# Altium project ADV212BBCZ-150.PrjPcb (part 2 of 2)

## Sheet PowerSupply.SchDoc
size A4; SheetNumber: 7; SheetTotal: 8
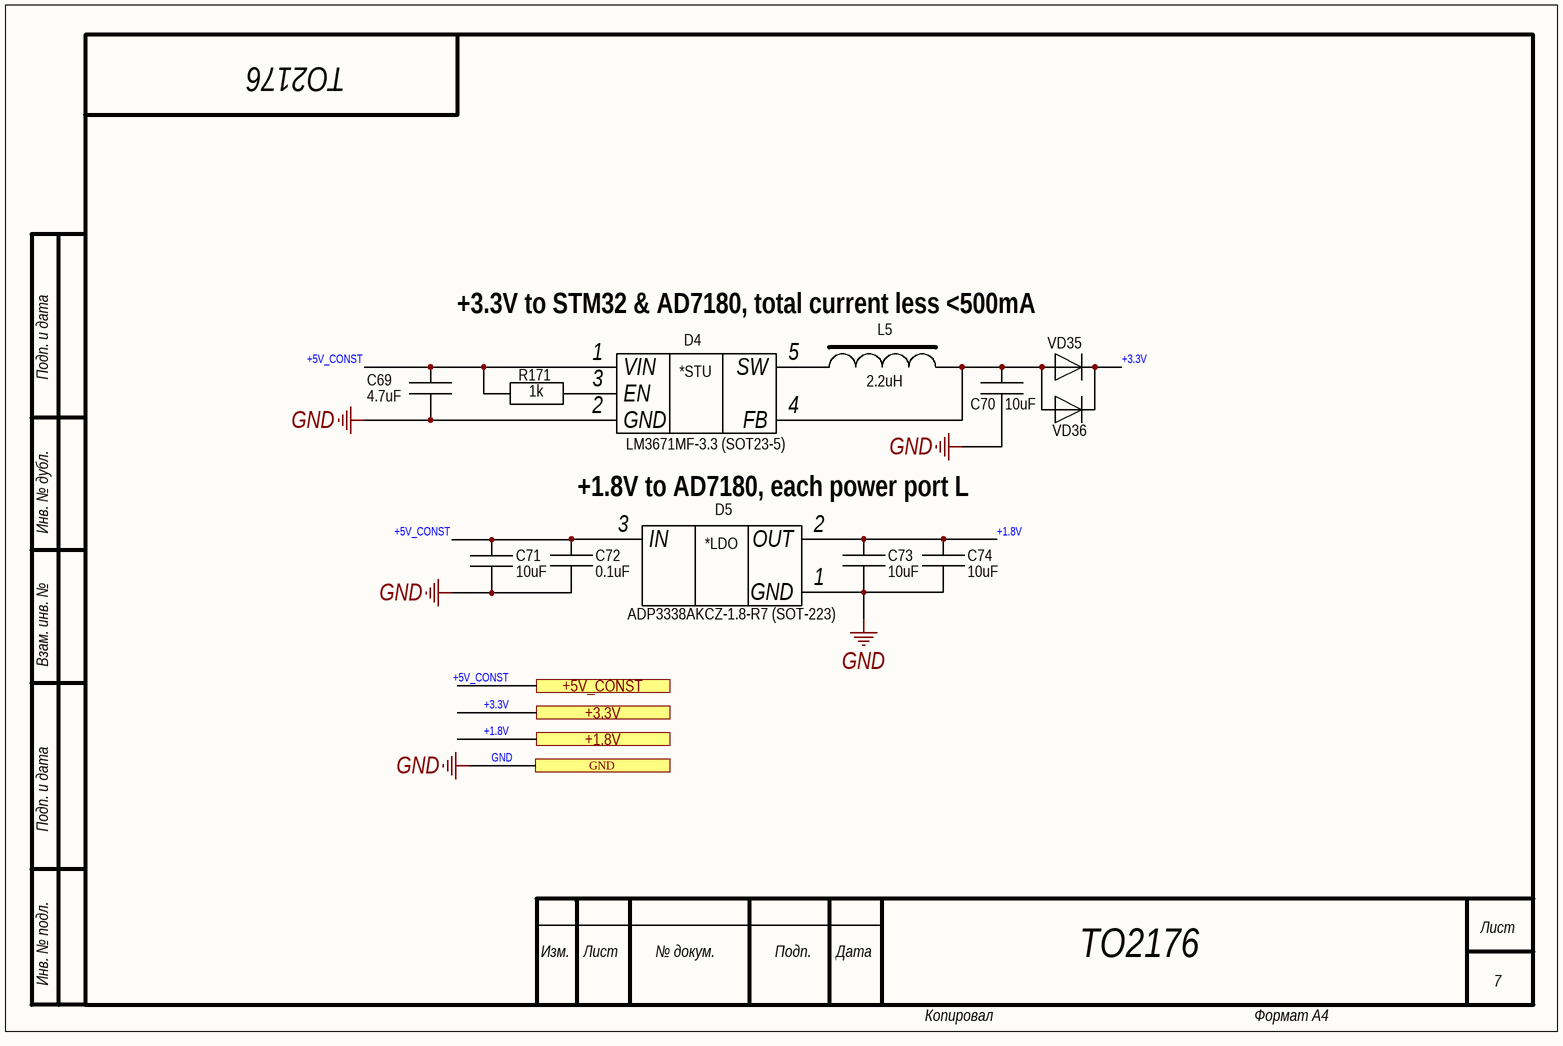
[diagram p7: PowerSupply.SchDoc]

### Parts
C69  4.7uF  [0603]
C70  10uF  [0603]
C71  10uF  [0603]
C72  0.1uF  [0603]
C73  10uF  [0603]
C74  10uF  [0603]
D4  LM3671MF-3.3 (SOT23-5)  [SOT-23-5]
D5  ADP3338AKCZ-1.8-R7 (SOT-223)  [SOT-223]
L5  2.2uH  [SRN3015 (3x3x1.5)]
R171  1k  [0603]
VD35  BAT60JFILM (SOD323)  [SOD323]  (value not drawn)
VD36  BAT60JFILM (SOD323)  [SOD323]  (value not drawn)

### Ports
+1.8V, +3.3V, +5V_CONST, GND

### Nets
+1.8V: C73.1 C74.1 D5.2(OUT) ; port +1.8V
+3.3V: VD35.2(K) VD36.2(K) ; port +3.3V
GND: C69.2 C70.2 C71.2 C72.2 C73.2 C74.2 D4.2(GND) D5.1(GND) ; port GND
+5V_CONST: C69.1 C71.1 C72.1 D4.1(VIN) D5.3(IN) R171.1 ; port +5V_CONST  [project net +5V]
NetC70_1: C70.1 D4.4(FB) L5.2 VD35.1(A) VD36.1(A)
NetD4_3: D4.3(EN) R171.2
NetD4_5: D4.5(SW) L5.1

### Notes on the sheet
- ТО2176
- +3.3V to STM32 & AD7180, total current less <500mA
- Подп. и дата
- +1.8V to AD7180, each power port L
- Инв. № дубл.
- Взам. инв. №
- Инв. № подл.
- Изм.
- Лист
- № докум.
- Подп.
- Дата
- 7
- Копировал
- Формат А4
- Перв. примен.
- Справ. №
- Разраб.
- Литера
- Масса
- Масштаб
- Пров.
- Т.контр.
- Листов
- Н.контр.
- Утв.
- Форма 1 ГОСТ 2.104-2006
- (in symbol ADP3338 (SOT-223)) *LDO
- (in symbol LM3671MF (SOT23-5)) *STU

### Library data of the parts
C69 = C0603: 4.7uF,16V (0603); ComponentHeigt: 1.3; Firme: AVX; Leadform: SMD; KIND: Конденсатор; ClassName: *; Component Link: *; ComponentWeigt: *; Packaging: 0805; NN: *; Value: *
C70 C71 C74 = C0603: 10uF,16V (0603); ComponentHeigt: 1.3; Firme: AVX; Leadform: SMD; KIND: Конденсатор; ClassName: *; Component Link: *; ComponentWeigt: *; Packaging: 0805; NN: *; Value: *
C72 C73 = C0603: 0.1uF,50V (0603); ComponentHeigt: 1.3; Firme: AVX; Leadform: SMD; KIND: Конденсатор; ClassName: *; Component Link: *; ComponentWeigt: *; Packaging: 0805; NN: *; Value: *
D4 = LM3671MF (SOT23-5): ComponentHeigt: 1.8; Firme: Linear; Leadform: формована; Kind: Микросхема; ClassName: *; Component Link: *; Packaging: SOT-223; NN: *
D5 = ADP3338 (SOT-223): ComponentHeigt: 1.8; Firme: Linear; Leadform: формована; Kind: Микросхема; ClassName: *; Component Link: *; Packaging: SOT-223; NN: *
L5 = SRN3015 (3x3x1.5): SRN3015-2R2M (2.2uH,1A); Value: {Value}; ComponentHeigt: 3.2; Firm: TDK; Name: Катушка индуктивности; Kind: Катушка индуктивности B82432T TDK; Typ: B82432T; NN: *; Packaging: SIMIT 1812-T
R171 = R0603 Yageo: ComponentHeigt: 0.5; Leadform: SMD; Firme: Yageo; Kind: Резистор; Packaging: 0402; ClassName: *; Component Link: *; NN: *
VD35 VD36 = BAT60JFILM (SOD323): ComponentHeigt: 0.75; Leadform: в отверстия; Firme: Kingbright; NN: 24003000; KIND: Светодиод L-1154GD Kingbright; Component Link: *; ClassName: *

## Sheet Button.SchDoc
size A4; SheetNumber: 8; SheetTotal: 8
Used 3 times, as channels BTN1, BTN2, BTN2. Parts and nets are listed once, with the designators drawn on the sheet.
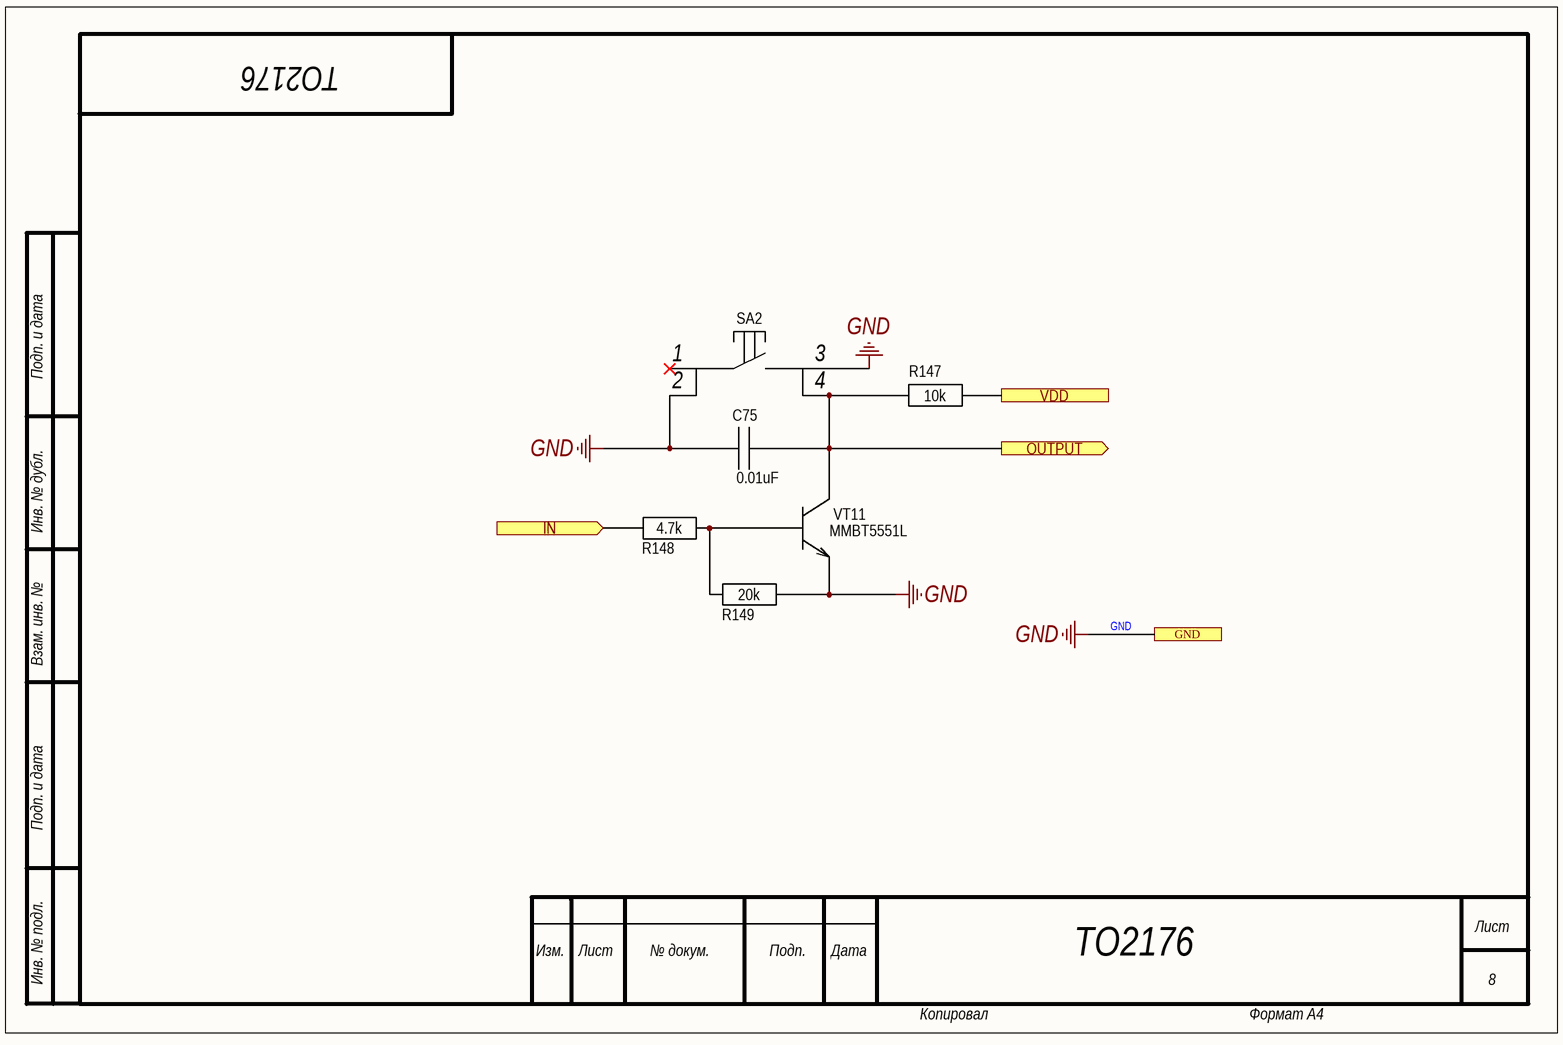
[diagram p8: Button.SchDoc]

### Parts
C75  0.01uF  [0805]
R147  10k  [0805]
R148  4.7k  [0805]
R149  20k  [0805]
SA2  KLS7-TS3401  [KLS7-TS3401]  (value not drawn)
VT11  MMBT5551L  [SOT-23]

### Ports
GND, IN (in), OUTPUT (out), VDD

### Nets
GND: C75.1 R149.1 SA2.2 SA2.3 VT11.2(E) ; port GND
IN: R148.2 ; port IN
OUTPUT: C75.2 R147.2 SA2.4 VT11.3(K) ; port OUTPUT
VDD: R147.1 ; port VDD
NetR148_1: R148.1 R149.2 VT11.1(B)

Not connected (* = marked no-connect by the designer): SA2 1*

### Channels
BTN1: designators end in _BTN1; ports GND=GND IN=RST_F OUTPUT=nRESET_STM VDD=+3.3V
BTN2: designators end in _BTN22; ports GND=GND IN=nRS_ADV212 OUTPUT=nRESET VDD=+3.3V
BTN2: designators end in _BTN21; ports GND=GND IN=nRS_ADV718 OUTPUT=nRST_ADV7180 VDD=+3.3V

### Notes on the sheet
- ТО2176
- Подп. и дата
- Инв. № дубл.
- Взам. инв. №
- Инв. № подл.
- Изм.
- Лист
- № докум.
- Подп.
- Дата
- 8
- Копировал
- Формат А4
- Перв. примен.
- Справ. №
- Разраб.
- Литера
- Масса
- Масштаб
- Пров.
- Т.контр.
- Листов
- Н.контр.
- Утв.
- Форма 1 ГОСТ 2.104-2006

### Library data of the parts
C75 = C0805: ComponentHeigt: 1.3; Firme: AVX; Leadform: SMD; KIND: Конденсатор; ClassName: *; Component Link: *; ComponentWeigt: *; Packaging: 0805; NN: *; Value: *
R147-R149 = R0805 Yageo: ComponentHeigt: 0.6; Firme: Yageo; Leadform: SMD; Kind: Резистор; ClassName: *; ComponentWeigt: *; Component Link: *; Packaging: 0805; NN: *; Value: *
SA2 = KLS7-TS3401: Component Heigt: 7; Leadform: SMD; Firme: TYCO; NN: 25100175; KIND: Кнопка 1-1977223-9 Tyco; ClassName: *; Component Link: *
VT11 = MMBT5551L: ComponentHeigt: 1.1; Firme: ONS; Leadform: SMD; NN: 24007468; KIND: Транзистор MMBT5551L*G ONS; ClassName: *; ComponentWeigt: *; Packaging: SOT-23

## Nets that join several sheets
+1.5V: ADV212 (32 pins), FORMULA (R169.2)
+1.8V: ADV7180 (L7.1 L8.1 L9.1), PowerSupply (C73.1 C74.1 D5.2)
+3.3V: Main (SA1.1), ADV212 (22 pins), FORMULA (R170.2)
+3.3V: Main (SA1.2), ADV212 (L1.1), STM32 (L2.1 L3.1 L4.1), ADV7180 (L6.1), RELE (R131.2 R138.2), PowerSupply (VD35.2 VD36.2), BTN1 (R147_BTN1.1), BTN2 (R147_BTN22.1), BTN2 (R147_BTN21.1)
GND: Main (8 pins), ADV212 (81 pins), STM32 (39 pins), FORMULA (X5.GND), ADV7180 (31 pins), RELE (26 pins), PowerSupply (8 pins), BTN1 (5 pins), BTN2 (5 pins), BTN2 (5 pins)
VCC_EXT: Main (X2.1), ADV212 (R172.1)
+5V: FORMULA (X5.+5V), RELE (22 pins), PowerSupply (6 pins)
ADDR0: ADV212 (D1.H12), STM32 (D2.58), FORMULA (X5.24)
ADDR1: ADV212 (D1.J10), STM32 (D2.59), FORMULA (X5.17)
ADDR2: ADV212 (D1.J11), STM32 (D2.60), FORMULA (X5.20)
ADDR3: ADV212 (D1.J12), STM32 (D2.2), FORMULA (X5.25)
Cb: Main (C49.1), ADV7180 (R99.1)
Cr: Main (C50.1), ADV7180 (R95.1)
DGND_1: ADV212 (32 pins), RELE (K11.4)
DGND_2: ADV212 (13 pins), RELE (K11.9)
FIELD: ADV212 (D1.E9), ADV7180 (R73.2)
FMC_D0: STM32 (D2.61), RELE (R107.2)
FMC_D1: STM32 (D2.62), RELE (R109.2)
FMC_D2: STM32 (D2.81), RELE (R103.2)
FMC_D3: STM32 (D2.82), RELE (R110.2)
FMC_D4: STM32 (D2.37), RELE (R104.2)
FMC_D5: STM32 (D2.38), RELE (R111.2)
FMC_D6: STM32 (D2.39), RELE (R105.2)
FMC_D7: STM32 (D2.40), RELE (R112.2)
FMC_D8: STM32 (D2.41), RELE (R106.2)
FMC_D9: STM32 (D2.42), RELE (R113.2)
FMC_D10: STM32 (D2.43), RELE (R108.2)
FMC_D11: STM32 (D2.44), RELE (R114.2)
FMC_D12: STM32 (D2.45), RELE (R134.2)
FMC_D13: STM32 (D2.55), RELE (R127.2)
FMC_D14: STM32 (D2.56), RELE (R128.2)
FMC_D15: STM32 (D2.57), RELE (R133.2)
GPO0: STM32 (D2.22), ADV7180 (R77.2)
GPO1: STM32 (D2.23), ADV7180 (R81.2)
GPO2: STM32 (D2.24), ADV7180 (R84.2)
GPO3: STM32 (D2.25), ADV7180 (R87.2)
HDATA0: ADV212 (D1.A4 R2.2), RELE (K1.4)
HDATA0_F: FORMULA (X5.16), RELE (K1.5)
HDATA1: ADV212 (D1.A3 R4.2), RELE (K1.9)
HDATA1_F: FORMULA (X5.15), RELE (K1.8)
HDATA2: ADV212 (D1.A2 R8.2), RELE (K2.4)
HDATA2_F: FORMULA (X5.2), RELE (K2.5)
HDATA3: ADV212 (D1.B3 R11.2), RELE (K2.9)
HDATA3_F: FORMULA (X5.1), RELE (K2.8)
HDATA4: ADV212 (D1.B2 R14.2), RELE (K3.4)
HDATA4_F: FORMULA (X5.14), RELE (K3.5)
HDATA5: ADV212 (D1.B1 R17.2), RELE (K3.9)
HDATA5_F: FORMULA (X5.13), RELE (K3.8)
HDATA6: ADV212 (D1.C3 R20.2), RELE (K4.4)
HDATA6_F: FORMULA (X5.4), RELE (K4.5)
HDATA7: ADV212 (D1.C2 R23.2), RELE (K4.9)
HDATA7_F: FORMULA (X5.3), RELE (K4.8)
HDATA8: ADV212 (D1.C1 R26.2), RELE (K5.4)
HDATA8_F: FORMULA (X5.12), RELE (K5.5)
HDATA9: ADV212 (D1.D3 R29.2), RELE (K5.9)
HDATA9_F: FORMULA (X5.11), RELE (K5.8)
HDATA10: ADV212 (D1.D2 R32.2), RELE (K6.4)
HDATA10_F: FORMULA (X5.8), RELE (K6.5)
HDATA11: ADV212 (D1.D1 R35.2), RELE (K6.9)
HDATA11_F: FORMULA (X5.7), RELE (K6.8)
HDATA12: ADV212 (D1.E3 R37.2), RELE (K7.9)
HDATA12_F: FORMULA (X5.5), RELE (K7.8)
HDATA13: ADV212 (D1.E2 R39.2), RELE (K7.4)
HDATA13_F: FORMULA (X5.6), RELE (K7.5)
HDATA14: ADV212 (D1.E1 R41.2), RELE (K8.4)
HDATA14_F: FORMULA (X5.10), RELE (K8.5)
HDATA15: ADV212 (D1.F4 R43.2), RELE (K8.9)
HDATA15_F: FORMULA (X5.9), RELE (K8.8)
HDATA16: ADV212 (D1.F3 R44.2), FORMULA (X5.49), ADV7180 (R80.2)
HDATA17: ADV212 (D1.F2 R42.2), FORMULA (X5.50), ADV7180 (R83.2)
HDATA18: ADV212 (D1.F1 R40.2), FORMULA (X5.51), ADV7180 (R86.2)
HDATA19: ADV212 (D1.G4 R38.2), FORMULA (X5.52), ADV7180 (R89.2)
HDATA20: ADV212 (D1.G3 R36.2), FORMULA (X5.53)
HDATA21: ADV212 (D1.G2 R33.2), FORMULA (X5.54)
HDATA22: ADV212 (D1.G1 R30.2), FORMULA (X5.56)
HDATA23: ADV212 (D1.H4 R27.2), FORMULA (X5.57)
HDATA24: ADV212 (D1.H3 R24.2), FORMULA (X5.60)
HDATA25: ADV212 (D1.H2 R21.2), FORMULA (X5.55)
HDATA26: ADV212 (D1.H1 R18.2), FORMULA (X5.58)
HDATA27: ADV212 (D1.J4 R15.2), FORMULA (X5.63)
HDATA28: ADV212 (D1.J3 R12.2), FORMULA (X5.62)
HDATA29: ADV212 (D1.J2 R9.2), FORMULA (X5.59)
HDATA30: ADV212 (D1.J1 R5.2), FORMULA (X5.61)
HDATA31: ADV212 (D1.K3 R3.2), FORMULA (X5.64)
HSYNC: ADV212 (D1.E11), ADV7180 (R68.2)
INTRQ: STM32 (D2.36), ADV7180 (R154.1)
nACK: ADV212 (D1.G11), STM32 (D2.71), FORMULA (X5.21)
nCS: ADV212 (D1.H11), STM32 (D2.88), FORMULA (X5.22)
nDACK0: ADV212 (D1.F11), RELE (K10.9)
nDACK0_STM: STM32 (D2.31), RELE (R136.2)
nDACK1: ADV212 (D1.F9), RELE (K10.4)
nDACK1_STM: STM32 (D2.30), RELE (R130.2)
nDREQ0: ADV212 (D1.F12), RELE (K9.9)
nDREQ0_STM: STM32 (D2.98), RELE (R135.2)
nDREQ1: ADV212 (D1.F10), RELE (K9.4)
nDREQ1_STM: STM32 (D2.97), RELE (R129.2)
nIRQ: ADV212 (D1.G10), STM32 (D2.77), FORMULA (X5.19)
nRD: ADV212 (D1.G12), STM32 (D2.85), FORMULA (X5.23)
nRESET: ADV212 (D1.L11), BTN2 (C75_BTN22.2 R147_BTN22.2 SA2_BTN22.4 VT11_BTN22.3)
nRESET_STM: STM32 (D2.14), BTN1 (C75_BTN1.2 R147_BTN1.2 SA2_BTN1.4 VT11_BTN1.3)
nRS_ADV212: STM32 (D2.34), BTN2 (R148_BTN22.2)
nRS_ADV718: STM32 (D2.35), BTN2 (R148_BTN21.2)
nRST_ADV7180: ADV7180 (R59.2), BTN2 (C75_BTN21.2 R147_BTN21.2 SA2_BTN21.4 VT11_BTN21.3)
nWE: ADV212 (D1.H10), STM32 (D2.86), FORMULA (X5.18)
RELE1: STM32 (D2.15 R155.1), RELE (R115.2)
RELE2: STM32 (D2.16 R156.1), RELE (R116.2)
RELE3: STM32 (D2.17 R157.1), RELE (R117.2)
RELE4: STM32 (D2.18 R158.1), RELE (R118.2)
RELE5: STM32 (D2.32 R159.1), RELE (R119.2)
RELE6: STM32 (D2.33 R160.1), RELE (R120.2)
RELE7: STM32 (D2.63 R161.1), RELE (R139.2)
RELE8: STM32 (D2.64 R162.1), RELE (R140.2)
RELE9: STM32 (D2.65 R163.1), RELE (R141.2)
RELE10: STM32 (D2.66 R164.1), RELE (R142.2)
RELE11: STM32 (D2.79 R165.1), RELE (R150.2)
RST_F: FORMULA (X5.OUT1), BTN1 (R148_BTN1.2)
SCLK: Main (KP2.1), STM32 (D2.92), ADV7180 (R62.2)
SCOMM4: ADV212 (D1.L1 R13.2), STM32 (D2.78), FORMULA (X5.48)
SDATA: Main (KP1.1), STM32 (D2.93), ADV7180 (R67.2)
SFL: STM32 (D2.90), ADV7180 (R72.2)
TRI_ZQ: ADV212 (ZQ1.1), STM32 (R69.2)
VCLK: ADV212 (D1.E12), ADV7180 (R78.2)
VDATA0: ADV212 (D1.A11), ADV7180 (R60.2)
VDATA1: ADV212 (D1.A10), ADV7180 (R65.2)
VDATA2: ADV212 (D1.A9), ADV7180 (R70.2)
VDATA3: ADV212 (D1.B12), ADV7180 (R75.2)
VDATA4: ADV212 (D1.B11), ADV7180 (R79.2)
VDATA5: ADV212 (D1.B10), ADV7180 (R82.2)
VDATA6: ADV212 (D1.C12), ADV7180 (R85.2)
VDATA7: ADV212 (D1.C11), ADV7180 (R88.2)
VDATA8: ADV212 (D1.C10), ADV7180 (R61.2)
VDATA9: ADV212 (D1.D12), ADV7180 (R66.2)
VDATA10: ADV212 (D1.D11), ADV7180 (R71.2)
VDATA11: ADV212 (D1.D10), ADV7180 (R76.2)
VSYNC: ADV212 (D1.E10), ADV7180 (R63.2)
Y: Main (C48.1), ADV7180 (R91.1)